# Altium schematic sheet 08-BOOTCFG QMCI SOM.SchDoc: BOOT_CFG
size 558 x 431 mm; Designer: B. Jordan; DsnPath: G:\My Drive\Quilter Computer - Engineering Assets\NXP i.MX8M-Mini\8MMINILPD4-CPU2-DESIGNFILES\8MMINILPD4-CPU2-DESIGNFILES\SCH-47712_A4.DSN; Author: B. Jordan; DrawnBy: B. Jordan; Revision: 0; SheetNumber: 08; SheetTotal: 10; CHK_APP_DATE: --/--/--; DSN_APP_DATE: --/--/--; ENG_APP_DATE: --/--/--
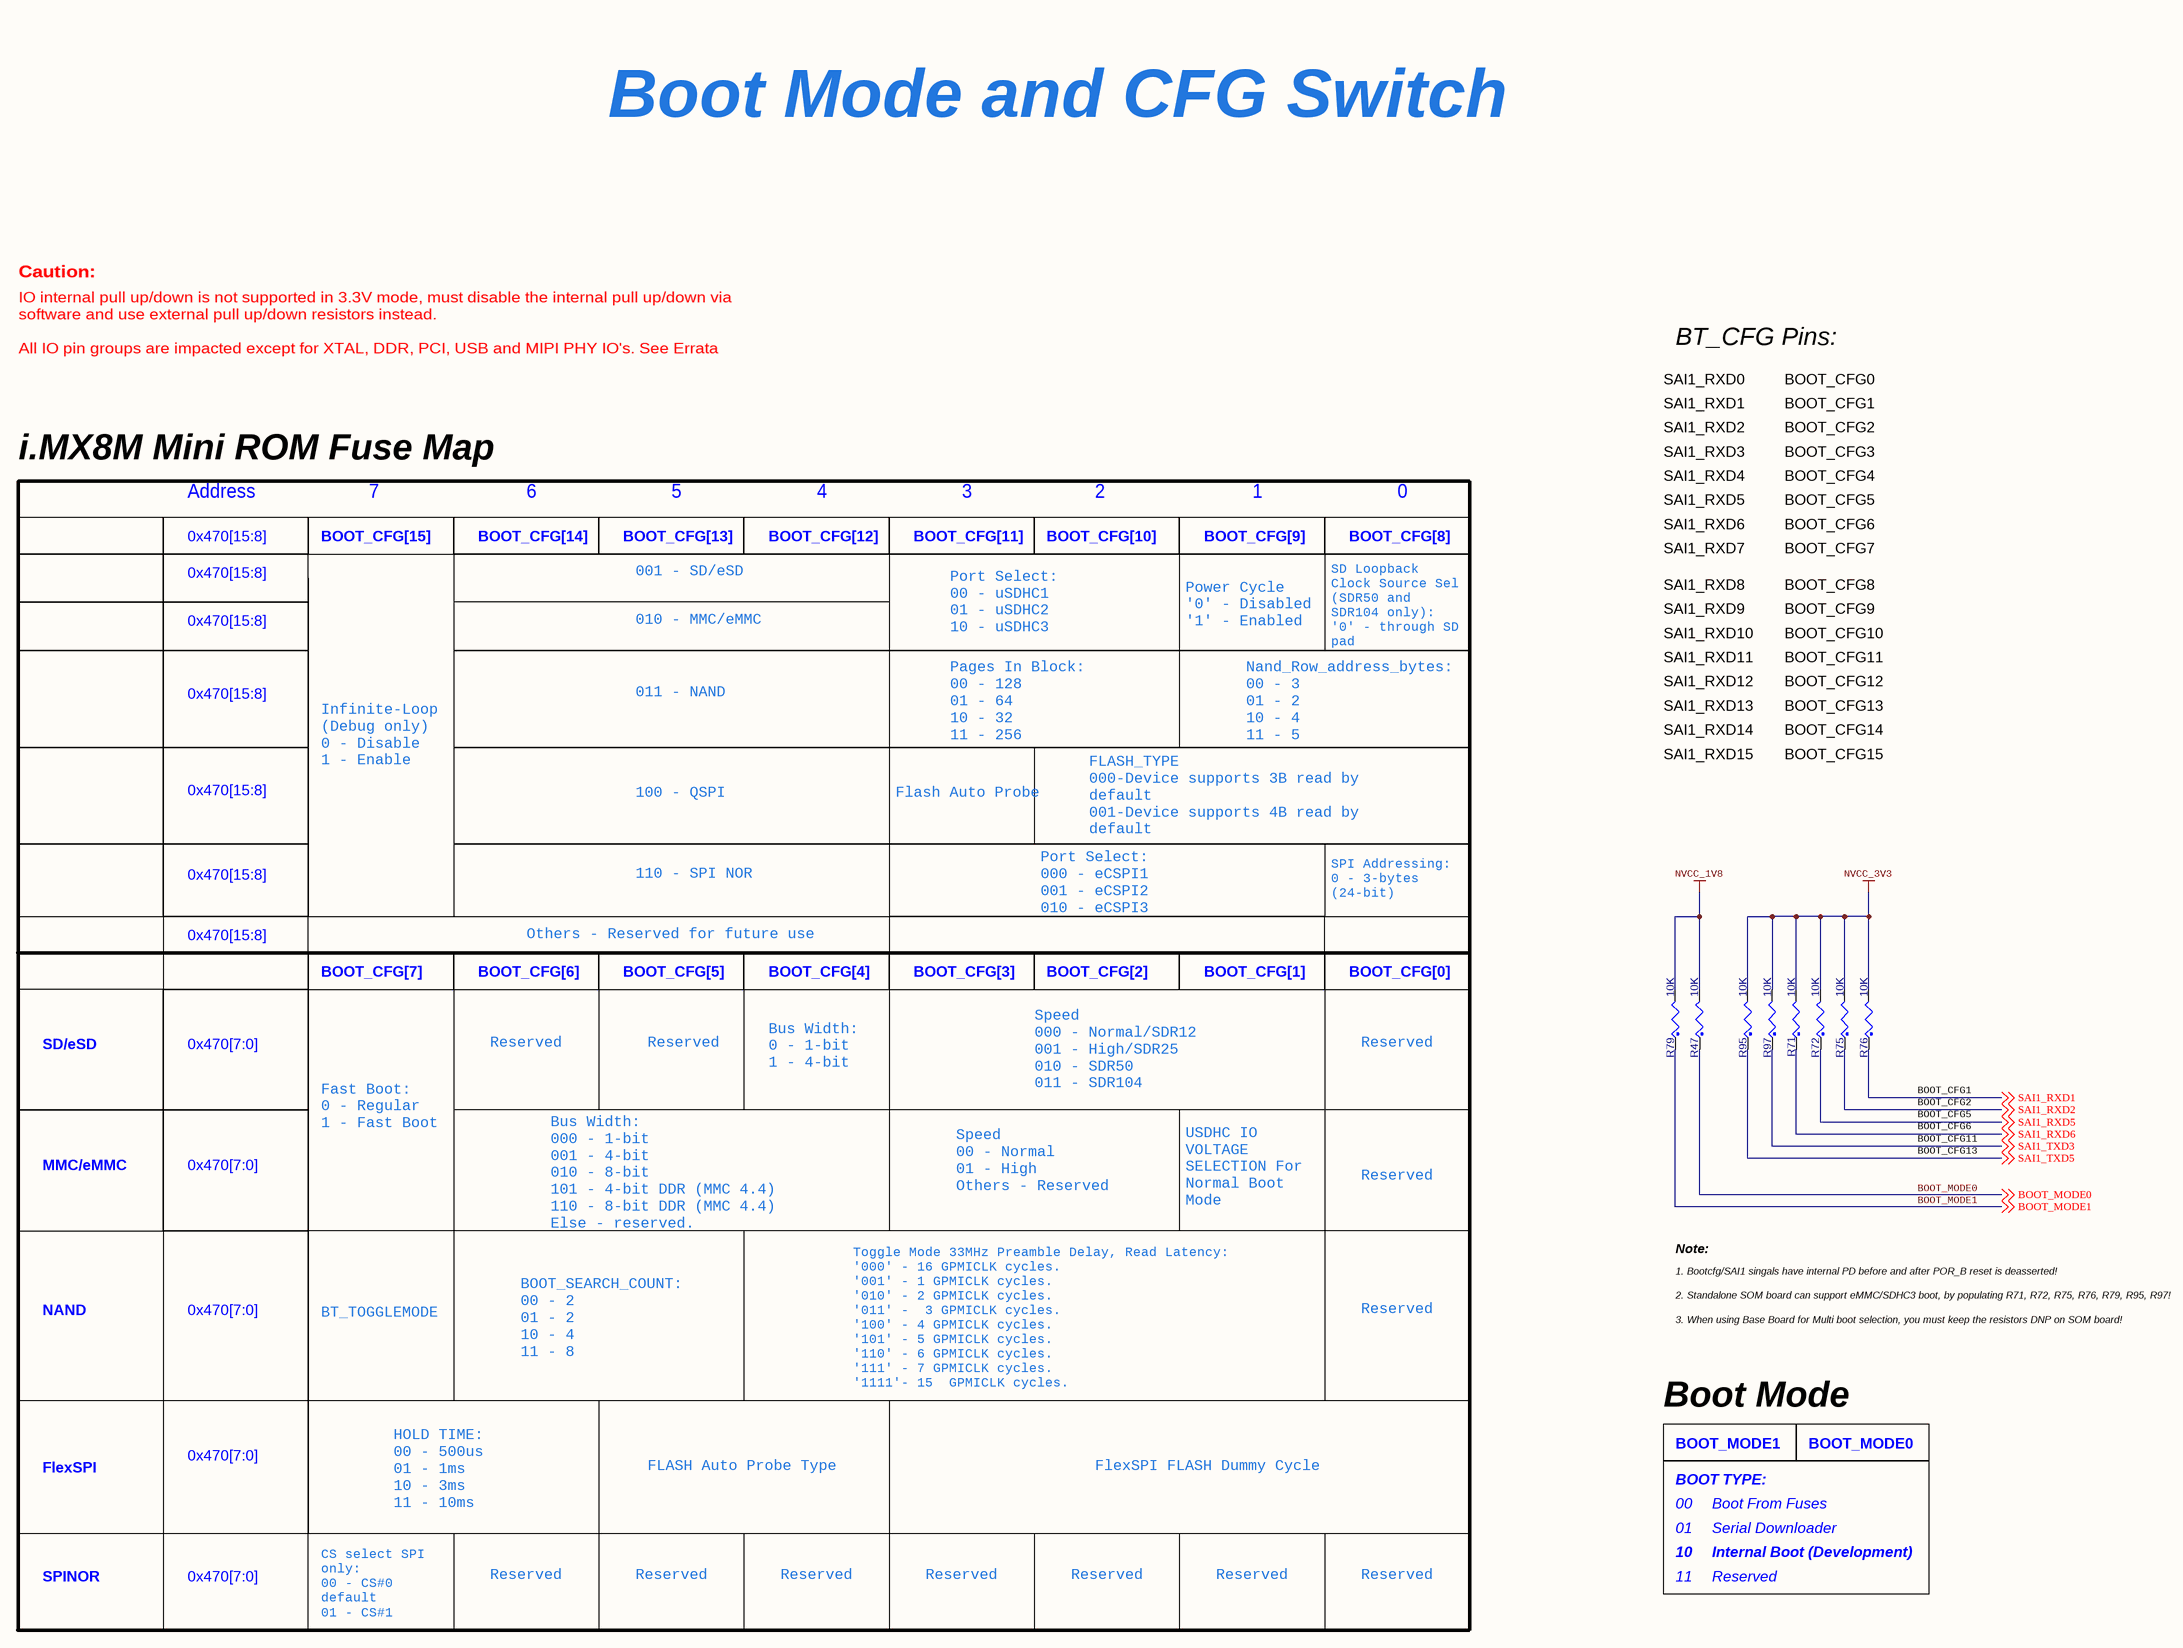
[diagram p0: 08-BOOTCFG QMCI SOM.SchDoc]

## Parts
R47  10K  [0402_CC]
R71  10K  [0402_CC]
R72  10K  [0402_CC]
R75  10K  [0402_CC]
R76  10K  [0402_CC]
R79  10K  [0402_CC]
R95  10K  [0402_CC]
R97  10K  [0402_CC]

## Nets
NVCC_1V8: R47.2 R79.2
NVCC_3V3: R71.2 R72.2 R75.2 R76.2 R95.2 R97.2
BOOT_MODE0: R47.1 ; off-sheet BOOT_MODE0
BOOT_MODE1: R79.1 ; off-sheet BOOT_MODE1
SAI1_RXD1: R76.1 ; off-sheet SAI1_RXD1
SAI1_RXD2: R75.1 ; off-sheet SAI1_RXD2
SAI1_RXD5: R72.1 ; off-sheet SAI1_RXD5
SAI1_RXD6: R71.1 ; off-sheet SAI1_RXD6
SAI1_TXD3: R97.1 ; off-sheet SAI1_TXD3
SAI1_TXD5: R95.1 ; off-sheet SAI1_TXD5

## Notes on the sheet
- Boot Mode and CFG Switch
- Caution:
- IO internal pull up/down is not supported in 3.3V mode, must disable the internal pull up/down via software and use external pull up/down resistors instead.
  All IO pin groups are impacted except for XTAL, DDR, PCI, USB and MIPI PHY IO's. See Errata e50080 for detailed information.
- BT_CFG Pins:
- SAI1_RXD0
- SAI1_RXD1
- BOOT_CFG0
- BOOT_CFG1
- i.MX8M Mini ROM Fuse Map
- SAI1_RXD2
- SAI1_RXD3
- SAI1_RXD4
- BOOT_CFG2
- BOOT_CFG3
- BOOT_CFG4
- 0x470[15:8]
- Address
- BOOT_CFG[15]
- 7
- BOOT_CFG[14]
- 6
- BOOT_CFG[13]
- 5
- BOOT_CFG[12]
- 4
- BOOT_CFG[11]
- 3
- BOOT_CFG[10]
- 2
- BOOT_CFG[9]
- 1
- BOOT_CFG[8]
- 0
- SAI1_RXD5
- SAI1_RXD6
- BOOT_CFG5
- BOOT_CFG6
- 001 - SD/eSD
- SAI1_RXD7
- SAI1_RXD8
- BOOT_CFG7
- BOOT_CFG8
- 010 - MMC/eMMC
- Port Select:
  00 - uSDHC1
  01 - uSDHC2
  10 - uSDHC3
- Power Cycle
  '0' - Disabled
  '1' - Enabled
- SD Loopback Clock Source Sel (SDR50 and SDR104 only):
  '0' - through SD pad
  '1' -  direct
- SAI1_RXD9
- SAI1_RXD10
- SAI1_RXD11
- BOOT_CFG9
- BOOT_CFG10
- BOOT_CFG11
- 011 - NAND
- SAI1_RXD12
- SAI1_RXD13
- BOOT_CFG12
- BOOT_CFG13
- Infinite-Loop
  (Debug only)
  0 - Disable
  1 - Enable
- Pages In Block:
  00 - 128
  01 - 64
  10 - 32
  11 - 256
- Nand_Row_address_bytes:
  00 - 3
  01 - 2
  10 - 4
  11 - 5
- SAI1_RXD14
- SAI1_RXD15
- BOOT_CFG14
- BOOT_CFG15
- 100 - QSPI
- Flash Auto Probe
- FLASH_TYPE
  000-Device supports 3B read by default
  001-Device supports 4B read by default
  010-HyperFlash 1V8
  011-HyperFlash 3V3
  100-MXIC Octal DDR
- 110 - SPI NOR
- Others - Reserved for future use
- Port Select:
  000 - eCSPI1
  001 - eCSPI2
  010 - eCSPI3
- SPI Addressing:
  0 - 3-bytes (24-bit)
  1 - 2-bytes (16-bit)
- BOOT_CFG[7]
- BOOT_CFG[6]
- BOOT_CFG[5]
- BOOT_CFG[4]
- BOOT_CFG[3]
- BOOT_CFG[2]
- BOOT_CFG[1]
- BOOT_CFG[0]
- SD/eSD
- 0x470[7:0]
- Reserved
- Bus Width:
  0 - 1-bit
  1 - 4-bit
- Speed
  000 - Normal/SDR12
  001 - High/SDR25
  010 - SDR50
  011 - SDR104
  Others - Reserved
- Fast Boot:
  0 - Regular
  1 - Fast Boot
- MMC/eMMC
- Bus Width:
  000 - 1-bit
  001 - 4-bit
  010 - 8-bit
  101 - 4-bit DDR (MMC 4.4)
  110 - 8-bit DDR (MMC 4.4)
  Else - reserved.
- Speed
  00 - Normal
  01 - High
  Others - Reserved
- USDHC IO VOLTAGE
  SELECTION For
  Normal Boot Mode
  0 - 3.3V
  1 - 1.8V
- Note:
- NAND
- BT_TOGGLEMODE
- 1. Bootcfg/SAI1 singals have internal PD before and after POR_B reset is deasserted!
- 2. Standalone SOM board can support eMMC/SDHC3 boot, by populating R71, R72, R75, R76, R79, R95, R97!
- 3. When using Base Board for Multi boot selection, you must keep the resistors DNP on SOM board!
- BOOT_SEARCH_COUNT:
  00 - 2
  01 - 2
  10 - 4
  11 - 8
- Toggle Mode 33MHz Preamble Delay, Read Latency:
  '000' - 16 GPMICLK cycles.
  '001' - 1 GPMICLK cycles.
  '010' - 2 GPMICLK cycles.
  '011' -  3 GPMICLK cycles.
  '100' - 4 GPMICLK cycles.
  '101' - 5 GPMICLK cycles.
  '110' - 6 GPMICLK cycles.
  '111' - 7 GPMICLK cycles.
  '1111'- 15  GPMICLK cycles.
- Boot Mode
- BOOT_MODE1
- BOOT_MODE0
- FlexSPI
- FLASH Auto Probe Type
- FlexSPI FLASH Dummy Cycle
- 00
- BOOT TYPE:
- Boot From Fuses
- HOLD TIME:
  00 - 500us
  01 - 1ms
  10 - 3ms
  11 - 10ms
- 01
- 10
- Serial Downloader
- Internal Boot (Development)
- SPINOR
- CS select SPI only:
  00 - CS#0  default
  01 - CS#1
  10 - CS#2
  11 - CS#3
- 11
- DWG. NO.
- REV.
- SHT.
- REVISION
- DESCRIPTION
- DATE
- APPROVED
- ENG:
- DSN:
- APPROVALS
- PROJECT
- REFERENCE DOCUMENTS
- BOM:
- CHK:
- TITLE
- ASSY DWG:
- FAB DWG:
- PCB DWG:
- SIZE
- FILE NAME
- C
- SCHEMATIC DOCUMENT NUMBER
- SHEET
- OF
- REV

## Library data of the parts
R47 R71 R75 = RES: RES MF 10K 1/16W 5% 0402; MFG_PN01: CRCW040210K0JNED; MFG_NAME01: VISHAY INTERTECHNOLOGY; EIA Case: 0402; Value: 10K; PCB Footprint: 0402_CC; ROHS: Yes; Tolerance: 5%; Rated Power: 1/16W
R72 R76 R79 R95 R97 = RES: RES MF 10K 1/16W 5% 0402; MFG_NAME01: VISHAY INTERTECHNOLOGY; MFG_PN01: CRCW040210K0JNED; EIA Case: 0402; Value: 10K; PCB Footprint: 0402_CC; Tolerance: 5%; ROHS: Yes; Rated Power: 1/16W